# Altium schematic sheet 14_DC_Reg_PMIC.SchDoc
size A3; SheetNumber: 7; SheetTotal: 21
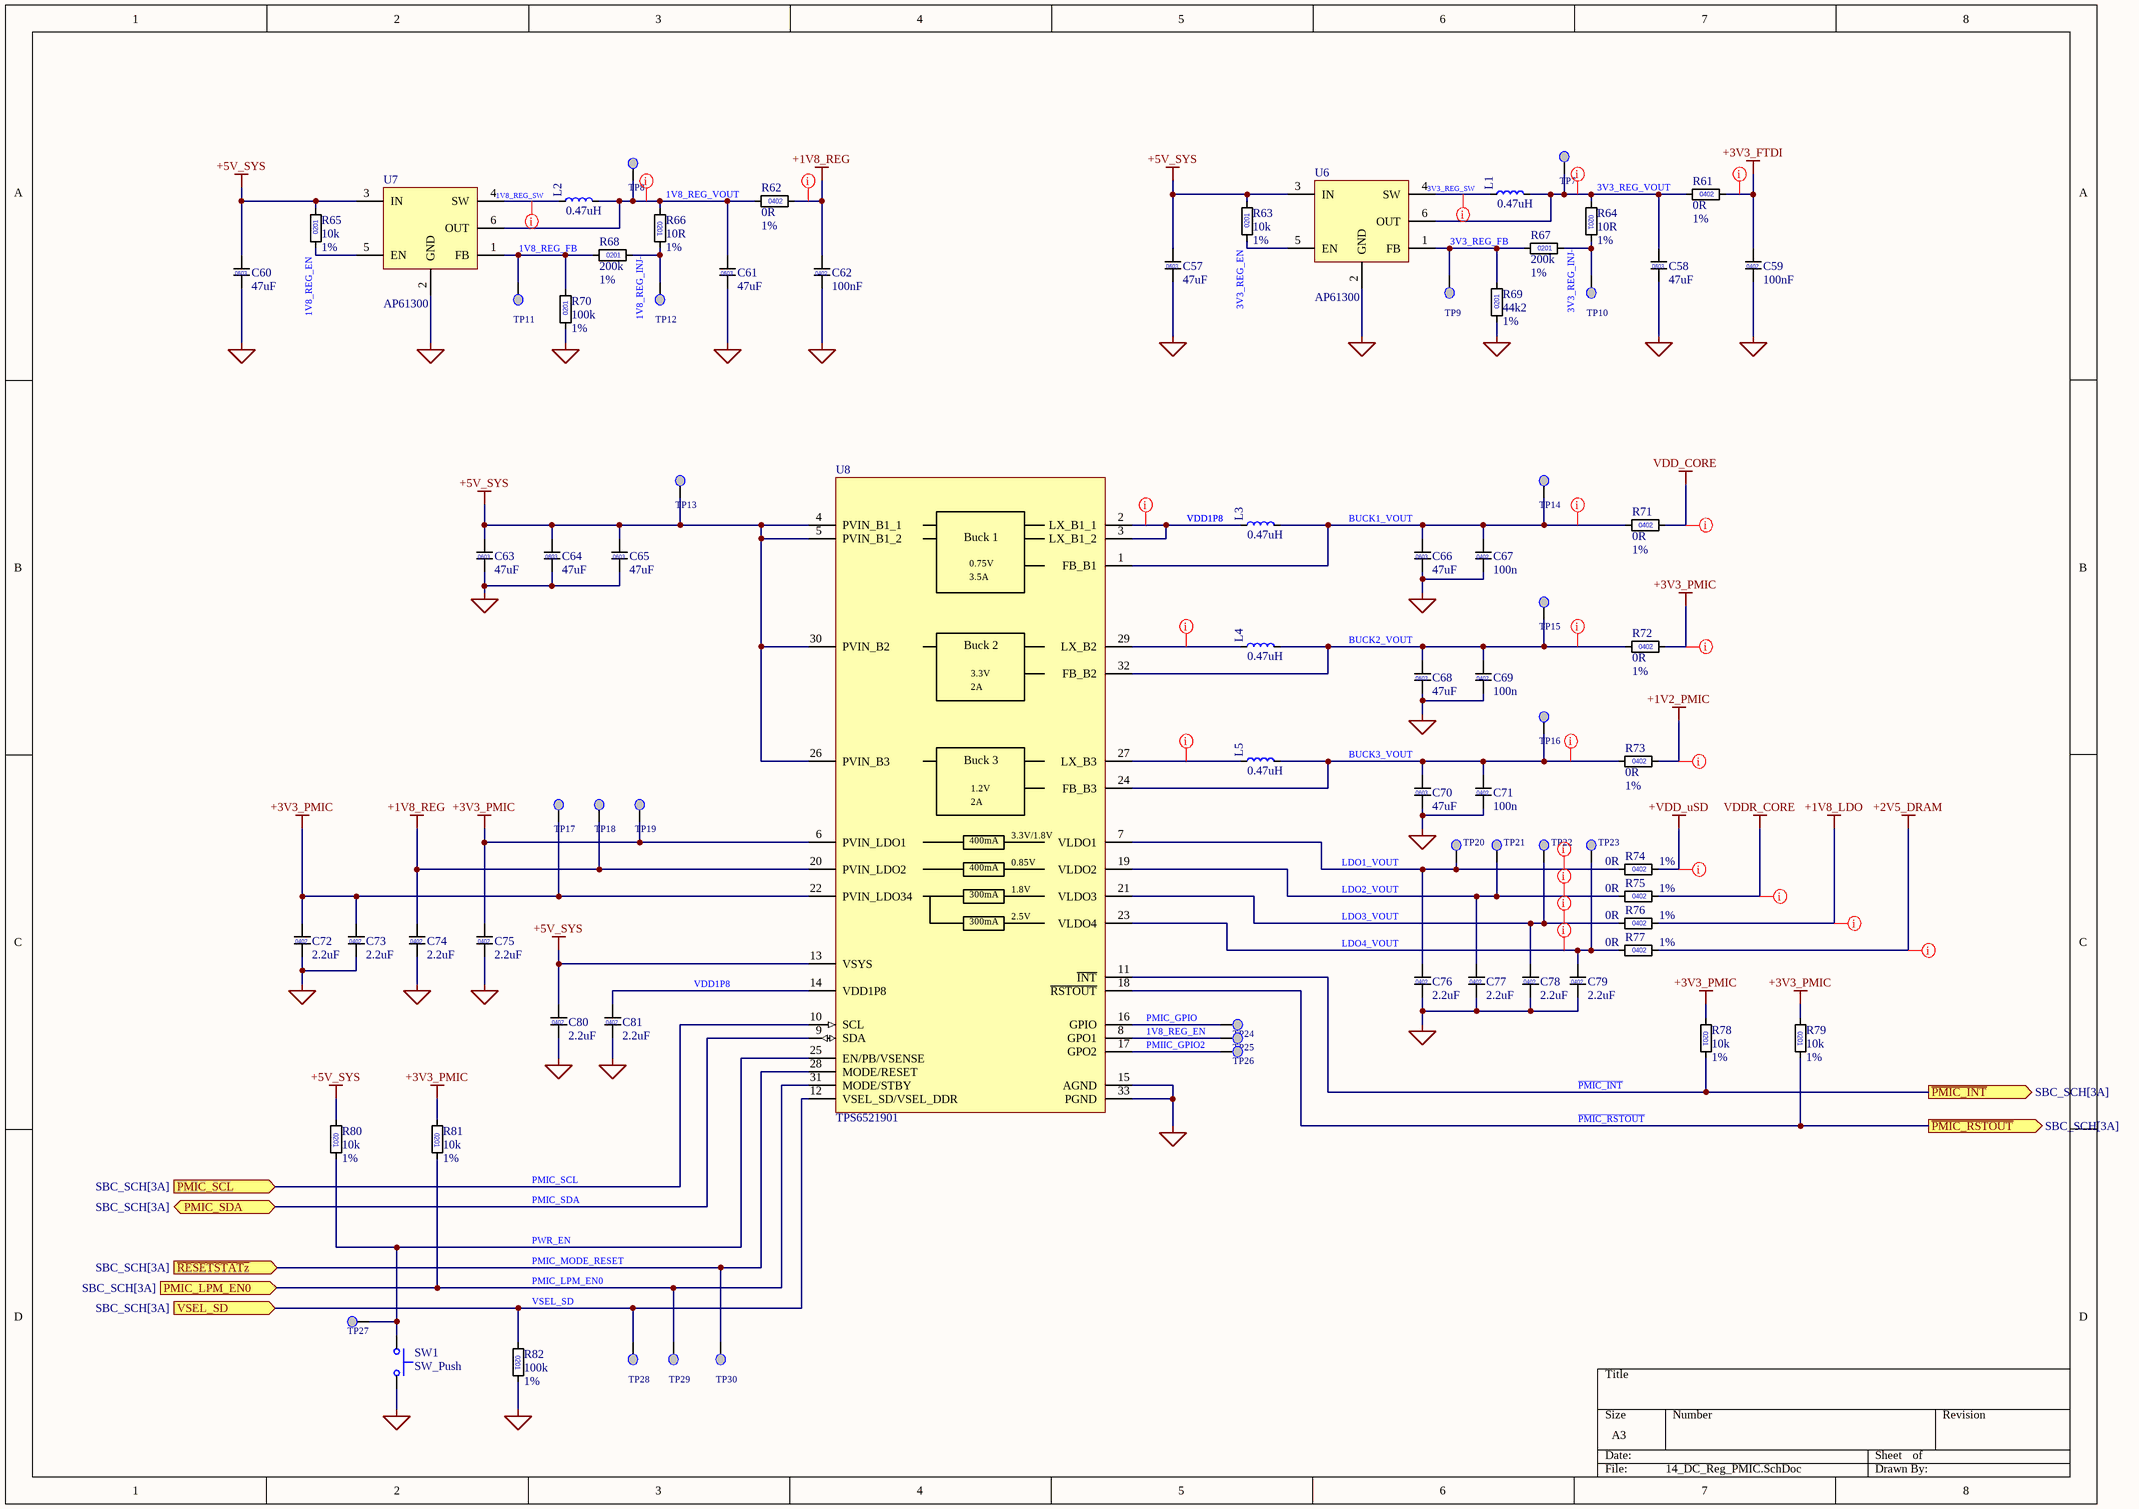
[diagram p0: 14_DC_Reg_PMIC.SchDoc]

## Parts
C57  value 47uF  (hidden comment: C_0603)
C58  value 47uF  (hidden comment: C_0603)
C59  value 100nF  [C0402]  (hidden comment: C_0402)
C60  value 47uF  (hidden comment: C_0603)
C61  value 47uF  (hidden comment: C_0603)
C62  value 100nF  [C0402]  (hidden comment: C_0402)
C63  value 47uF  (hidden comment: C_0603)
C64  value 47uF  (hidden comment: C_0603)
C65  value 47uF  (hidden comment: C_0603)
C66  value 47uF  (hidden comment: C_0603)
C67  value 100n  [C0402]  (hidden comment: C_0402)
C68  value 47uF  (hidden comment: C_0603)
C69  value 100n  [C0402]  (hidden comment: C_0402)
C70  value 47uF  (hidden comment: C_0603)
C71  value 100n  [C0402]  (hidden comment: C_0402)
C72  value 2.2uF  [C0402]  (hidden comment: C_0402)
C73  value 2.2uF  [C0402]  (hidden comment: C_0402)
C74  value 2.2uF  [C0402]  (hidden comment: C_0402)
C75  value 2.2uF  [C0402]  (hidden comment: C_0402)
C76  value 2.2uF  [C0402]  (hidden comment: C_0402)
C77  value 2.2uF  [C0402]  (hidden comment: C_0402)
C78  value 2.2uF  [C0402]  (hidden comment: C_0402)
C79  value 2.2uF  [C0402]  (hidden comment: C_0402)
C80  value 2.2uF  [C0402]  (hidden comment: C_0402)
C81  value 2.2uF  [C0402]  (hidden comment: C_0402)
L1  value 0.47uH  (hidden comment: L)
L2  value 0.47uH  (hidden comment: L)
L3  value 0.47uH  (hidden comment: L)
L4  value 0.47uH  (hidden comment: L)
L5  value 0.47uH  (hidden comment: L)
R61  value 0R  Tolerance: 1%  [R0402]  (hidden comment: 0402)
R62  value 0R  Tolerance: 1%  [R0402]  (hidden comment: 0402)
R63  value 10k  Tolerance: 1%  [R0201]  (hidden comment: 0201)
R64  value 10R  Tolerance: 1%  [R0201]  (hidden comment: 0201)
R65  value 10k  Tolerance: 1%  [R0201]  (hidden comment: 0201)
R66  value 10R  Tolerance: 1%  [R0201]  (hidden comment: 0201)
R67  value 200k  Tolerance: 1%  [R0201]  (hidden comment: 0201)
R68  value 200k  Tolerance: 1%  [R0201]  (hidden comment: 0201)
R69  value 44k2  Tolerance: 1%  [R0201]  (hidden comment: 0201)
R70  value 100k  Tolerance: 1%  [R0201]  (hidden comment: 0201)
R71  value 0R  Tolerance: 1%  [R0402]  (hidden comment: 0402)
R72  value 0R  Tolerance: 1%  [R0402]  (hidden comment: 0402)
R73  value 0R  Tolerance: 1%  [R0402]  (hidden comment: 0402)
R74  value 0R  Tolerance: 1%  [R0402]  (hidden comment: 0402)
R75  value 0R  Tolerance: 1%  [R0402]  (hidden comment: 0402)
R76  value 0R  Tolerance: 1%  [R0402]  (hidden comment: 0402)
R77  value 0R  Tolerance: 1%  [R0402]  (hidden comment: 0402)
R78  value 10k  Tolerance: 1%  [R0201]  (hidden comment: 0201)
R79  value 10k  Tolerance: 1%  [R0201]  (hidden comment: 0201)
R80  value 10k  Tolerance: 1%  [R0201]  (hidden comment: 0201)
R81  value 10k  Tolerance: 1%  [R0201]  (hidden comment: 0201)
R82  value 100k  Tolerance: 1%  [R0201]  (hidden comment: 0201)
SW1  SW_Push
TP7  Testpoint 0.5mm  [TP_0.50mm]  (value not drawn)  (no BOM)
TP8  Testpoint 0.5mm  [TP_0.50mm]  (value not drawn)  (no BOM)
TP9  Testpoint 0.5mm  [TP_0.50mm]  (value not drawn)  (no BOM)
TP10  Testpoint 0.5mm  [TP_0.50mm]  (value not drawn)  (no BOM)
TP11  Testpoint 0.5mm  [TP_0.50mm]  (value not drawn)  (no BOM)
TP12  Testpoint 0.5mm  [TP_0.50mm]  (value not drawn)  (no BOM)
TP13  Testpoint 0.5mm  [TP_0.50mm]  (value not drawn)  (no BOM)
TP14  Testpoint 0.5mm  [TP_0.50mm]  (value not drawn)  (no BOM)
TP15  Testpoint 0.5mm  [TP_0.50mm]  (value not drawn)  (no BOM)
TP16  Testpoint 0.5mm  [TP_0.50mm]  (value not drawn)  (no BOM)
TP17  Testpoint 0.5mm  [TP_0.50mm]  (value not drawn)  (no BOM)
TP18  Testpoint 0.5mm  [TP_0.50mm]  (value not drawn)  (no BOM)
TP19  Testpoint 0.5mm  [TP_0.50mm]  (value not drawn)  (no BOM)
TP20  Testpoint 0.5mm  [TP_0.50mm]  (value not drawn)  (no BOM)
TP21  Testpoint 0.5mm  [TP_0.50mm]  (value not drawn)  (no BOM)
TP22  Testpoint 0.5mm  [TP_0.50mm]  (value not drawn)  (no BOM)
TP23  Testpoint 0.5mm  [TP_0.50mm]  (value not drawn)  (no BOM)
TP24  Testpoint 0.5mm  [TP_0.50mm]  (value not drawn)  (no BOM)
TP25  Testpoint 0.5mm  [TP_0.50mm]  (value not drawn)  (no BOM)
TP26  Testpoint 0.5mm  [TP_0.50mm]  (value not drawn)  (no BOM)
TP27  Testpoint 0.5mm  [TP_0.50mm]  (value not drawn)  (no BOM)
TP28  Testpoint 0.5mm  [TP_0.50mm]  (value not drawn)  (no BOM)
TP29  Testpoint 0.5mm  [TP_0.50mm]  (value not drawn)  (no BOM)
TP30  Testpoint 0.5mm  [TP_0.50mm]  (value not drawn)  (no BOM)
U6  AP61300  [SOT563]
U7  AP61300  [SOT563]
U8  TPS6521901  [QFN-32-1EP_5x5mm_P0.5mm_EP3.7x3.7mm]

## Ports
PMIC_LPM_EN0 (in, see SBC_SCH[3A]), PMIC_SCL (in, see SBC_SCH[3A]), PMIC_SDA (bidir, see SBC_SCH[3A]), VSEL_SD (in, see SBC_SCH[3A]), ~{PMIC_INT} (out, see SBC_SCH[3A]), ~{PMIC_RSTOUT} (out, see SBC_SCH[3A]), ~{RESETSTATz} (in, see SBC_SCH[3A])

## Nets
+1V2_PMIC: R73.2
+1V8_LDO: R76.2
+1V8_REG: C62.1 C74.1 R62.2 TP18.TP U8.20(PVIN_LDO2)
+2V5_DRAM: R77.2
+3V3_FTDI: C59.1 R61.2
+3V3_PMIC: C72.1 C73.1 C75.1 R72.2 R78.1 R79.1 R81.1 TP17.TP TP19.TP U8.6(PVIN_LDO1) U8.22(PVIN_LDO34)
+5V_SYS: C57.1 C60.1 C63.1 C64.1 C65.1 C80.1 R63.2 R65.2 R80.1 TP13.TP U6.3(IN) U7.3(IN) U8.4(PVIN_B1_1) U8.5(PVIN_B1_2) U8.13(VSYS) U8.26(PVIN_B3) U8.30(PVIN_B2)
+VDD_uSD: R74.2
GND: C57.2 C58.2 C59.2 C60.2 C61.2 C62.2 C63.2 C64.2 C65.2 C66.2 C67.2 C68.2 C69.2 C70.2 C71.2 C72.2 C73.2 C74.2 C75.2 C76.2 C77.2 C78.2 C79.2 C80.2 C81.2 R69.1 R70.1 R82.2 SW1.1 U6.2(GND) U7.2(GND) U8.15(AGND) U8.33(PGND)
VDD_CORE: R71.2
VDDR_CORE: R75.2
1V8_REG_EN: R65.1 TP25.TP U7.5(EN) U8.8(GPO1)
1V8_REG_FB: R68.1 R70.2 TP11.TP U7.1(FB)
1V8_REG_INJ-: R66.2 R68.2 TP12.TP
1V8_REG_SW: L2.1 U7.4(SW)
1V8_REG_VOUT: C61.1 L2.2 R62.1 R66.1 TP8.TP U7.6(OUT)
3V3_REG_EN: R63.1 U6.5(EN)
3V3_REG_FB: R67.1 R69.2 TP9.TP U6.1(FB)
3V3_REG_INJ-: R64.2 R67.2 TP10.TP
3V3_REG_SW: L1.1 U6.4(SW)
3V3_REG_VOUT: C58.1 L1.2 R61.1 R64.1 TP7.TP U6.6(OUT)
~{PMIC_INT}: R78.2 U8.11(~{INT}) ; port ~{PMIC_INT}
~{PMIC_RSTOUT}: R79.2 U8.18(~{RSTOUT}) ; port ~{PMIC_RSTOUT}
BUCK1_VOUT: C66.1 C67.1 L3.2 R71.1 TP14.TP U8.1(FB_B1)
BUCK2_VOUT: C68.1 C69.1 L4.2 R72.1 TP15.TP U8.32(FB_B2)
BUCK3_VOUT: C70.1 C71.1 L5.2 R73.1 TP16.TP U8.24(FB_B3)
LDO1_VOUT: C76.1 R74.1 TP20.TP U8.7(VLDO1)
LDO2_VOUT: C77.1 R75.1 TP21.TP U8.19(VLDO2)
LDO3_VOUT: C78.1 R76.1 TP22.TP U8.21(VLDO3)
LDO4_VOUT: C79.1 R77.1 TP23.TP U8.23(VLDO4)
PMIC_GPIO: TP24.TP U8.16(GPIO)
PMIC_LPM_EN0: R81.2 TP29.TP U8.31(MODE/STBY) ; port PMIC_LPM_EN0
PMIC_MODE_RESET: TP30.TP U8.28(MODE/RESET) ; port ~{RESETSTATz}
PMIC_SCL: U8.10(SCL) ; port PMIC_SCL
PMIC_SDA: U8.9(SDA) ; port PMIC_SDA
PMIIC_GPIO2: TP26.TP U8.17(GPO2)
PWR_EN: R80.2 SW1.2 TP27.TP U8.25(EN/PB/VSENSE)
VDD1P8: C81.1 L3.1 U8.2(LX_B1_1) U8.3(LX_B1_2) U8.14(VDD1P8)
VSEL_SD: R82.1 TP28.TP U8.12(VSEL_SD/VSEL_DDR) ; port VSEL_SD
NetL4_1: L4.1 U8.29(LX_B2)
NetL5_1: L5.1 U8.27(LX_B3)

## Layout directives
net class PWR: 1V8_REG_SW, 1V8_REG_VOUT, 3V3_REG_SW, 3V3_REG_VOUT, +1V2_PMIC, +1V8_LDO, +1V8_REG, +2V5_DRAM, +3V3_FTDI, +3V3_PMIC, +VDD_uSD, BUCK1_VOUT, BUCK2_VOUT, BUCK3_VOUT, LDO1_VOUT, LDO2_VOUT, LDO3_VOUT, LDO4_VOUT, NetL4_1, NetL5_1, VDD1P8, VDD_CORE, VDDR_CORE

## Notes on the sheet
- (in symbol C_0402) 0402
- (in symbol C_0603) 0603
- (in symbol TPS6521901RSMR) Buck 1; 0.75V; 3.5A; Buck 2; 3.3V; 2A; Buck 3; 1.2V; 3.3V/1.8V; 400mA; 0.85V; 1.8V; 300mA; 2.5V

## Library data of the parts
C57 C58 C60 C61 C63-C66 C68 C70 = C_0603: MLCC 0603; Manufacturer_Name: *; Manufacturer_Part_Number: *
C59 C62 C67 C69 C71-C81 = C_0402: MLCC 0402; Manufacturer_Name: *; Manufacturer_Part_Number: *
L1-L5 = L_0806: Inductor; Manufacturer_Name: *; Manufacturer_Part_Number: *
R61 R62 R71-R77 = R_0402: Manufacturer_Name: *; Manufacturer_Part_Number: *
R63-R70 R78-R82 = R_0201: Manufacturer_Name: *; Manufacturer_Part_Number: *
SW1 = SW_Push: Push button switch, generic, two pins
U6 U7 = AP61300: Buck Switching Regulator IC Positive Adjustable 0.6V 1 Output 3A SOT-563; Manufacturer_Name: Diodes Incorporated; Manufacturer_Part_Number: AP61300Z6-7; Value: AP61300
U8 = TPS6521901RSMR: PMIC, 3 bucks + 4 LDOs, I2C, NVM 07, 4x4mm RHB VQFN-32 plus exposed PGND pad 33; MPN: TPS6521901RSMR; Footprint_Note: Generic footprint candidate: 5x5mm, 0.5mm pitch, EP3.7mm. Exists locally; pad lengths differ from TI RHB0032W recommended land pattern. Review before PCB fabrication.; Datasheet: https://www.ti.com/lit/ds/symlink/tps65219.pdf; ComponentLink1Description: Datasheet; ComponentLink1URL: https://www.ti.com/lit/ds/symlink/tps65219.pdf